# Altium schematic sheet USB_Power.SchDoc
size A4; DocumentNumber: 4; SheetNumber: 4; SheetTotal: 28
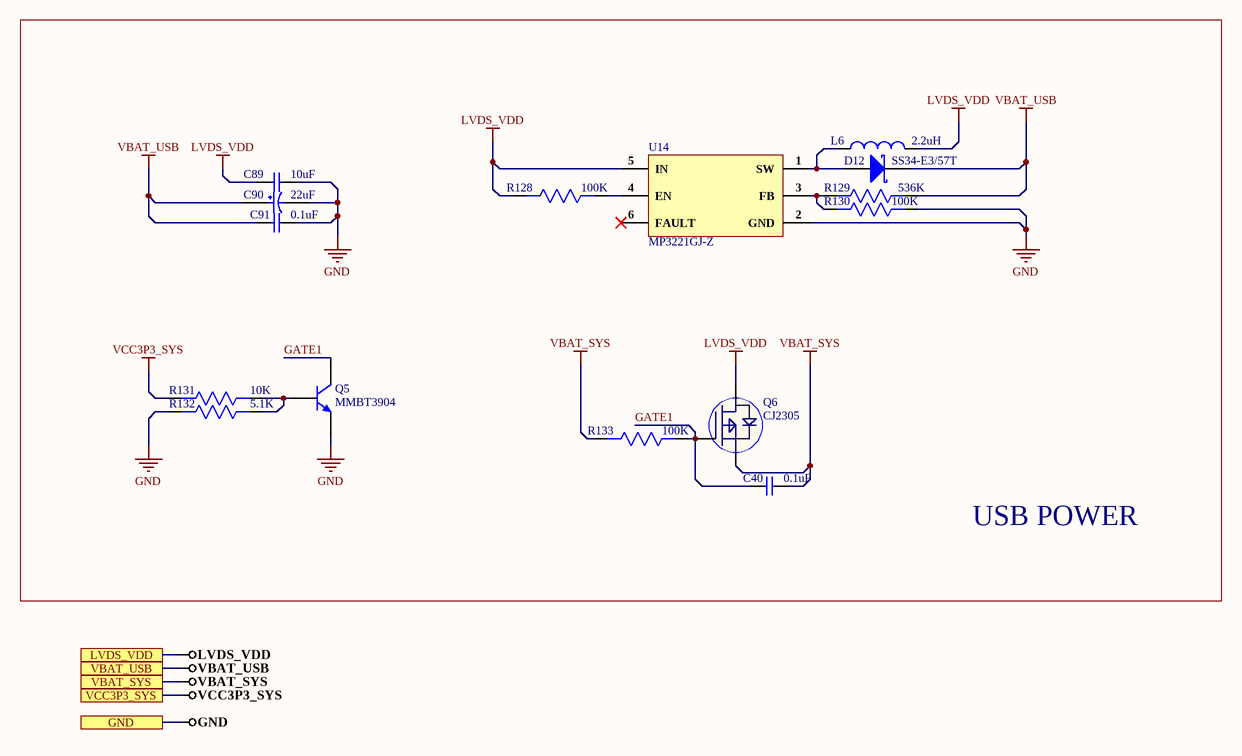
[diagram p0: USB_Power.SchDoc]

## Parts
C40  0.1uF  [Cap0603]
C89  10uF  [Cap0603]
C90  22uF  [T491C226K025AT]
C91  0.1uF  [Cap0603]
D12  SS34-E3/57T  [SMC]
L6  2.2uH  [74437324022]
Q5  MMBT3904  [SOT-23]
Q6  CJ2305  [SOT-23]
R128  100K  [Res0603]
R129  536K  [Res0603]
R130  100K  [Res0603]
R131  10K  [Res0603]
R132  5.1K  [Res0603]
R133  100K  [Res0603]
U14  MP3221GJ-Z  [TSOT-23-6]

## Blocks framed on the sheet
USB POWER: C40 C89-C91 D12 L6 Q5 Q6 R128-R133 U14

## Ports
GND, LVDS_VDD, VBAT_SYS, VBAT_USB, VCC3P3_SYS

## Nets
GND: C89.2 C90.2 C91.2 Q5.2(E) R130.1 R132.2 U14.2(GND) ; port GND
LVDS_VDD: C89.1 L6.2 Q6.3(D) R128.2 U14.5(IN) ; port LVDS_VDD
VBAT_SYS: C40.2 Q6.2(S) R133.2 ; port VBAT_SYS
VBAT_USB: C90.1 C91.1 D12.1(K) R129.1 ; port VBAT_USB
VCC3P3_SYS: R131.2 ; port VCC3P3_SYS
GATE1: C40.1 Q5.3(C) Q6.1(G) R133.1
NetD12_2: D12.2(A) L6.1 U14.1(SW)
NetQ5_1: Q5.1(B) R131.1 R132.1
NetR128_1: R128.1 U14.4(EN)
NetR129_2: R129.2 R130.2 U14.3(FB)

Not connected (* = marked no-connect by the designer): U14 6(FAULT)*

## Library data of the parts
C40 C91 = CC0603ZRY5V9BB104: CAP CER 0.1UF 50V Y5V 0603; Manufacturer: Yageo; Capacitance: 100nF; Tolerance: 80%; Supplier 1: Digi-Key; Manufacturer Part Number: CC0603ZRY5V9BB104; Stock 1: 15000880; Pricing 1: 1=0.1, 10=0.075, 100=0.0334, 500=0.02386, 1000=0.01874 (USD); Mount: Surface Mount; Case/Package: 0603; Number of Pins: 2; Case Code (Metric): 1608; Case Code (Imperial): 0603; Min Operating Temperature: -30°C; Max Operating Temperature: 85°C; Dielectric: Y5V; Voltage Rating: 50V; Package Quantity: 1; Packaging: Tape and Reel; Voltage Rating (DC): 50V; Termination: SMD/SMT; Composition: Ceramic; Voltage: 50V; Length: 1.6mm; Height: 0.8mm; Width: 0.031inch; Thickness: 0.035inch; Depth: 0.8mm; Radiation Hardening: No; REACH SVHC: No SVHC; Lead Free: Lead Free; Halogen Free: Halogen Free; ComponentLink1URL: http://www.yageo.com/documents/recent/UPY-GPHC_Y5V_6.3V-to-50V_8.pdf?src-supplier=Digi-Key; ComponentLink1Description: http://www.yageo.com/documents/recent/UPY-GPHC_Y5V_6.3V-to-50V_8.pdf?src-supplier=Digi-Key; ComponentLink2URL: http://www.yageo.com/documents/recent/UPY-GPHC_Y5V_6.3V-to-50V_5.pdf?src-supplier=Avnet+Europe; ComponentLink2Description: http://www.yageo.com/documents/recent/UPY-GPHC_Y5V_6.3V-to-50V_5.pdf?src-supplier=Avnet+Europe; ComponentLink3URL: https://www.verical.com/server-webapp/html/getDatasheet?partID=403611&src-supplier=Verical; ComponentLink3Description: https://www.verical.com/server-webapp/html/getDatasheet?partID=403611&src-supplier=Verical; ComponentLink4URL: http://www.mouser.com/ds/2/447/Yageo_UPY-GP_NP0_16V-to-50V_9-358835.pdf?src-supplier=Mouser; ComponentLink4Description: http://www.mouser.com/ds/2/447/Yageo_UPY-GP_NP0_16V-to-50V_9-358835.pdf?src-supplier=Mouser; ComponentLink5URL: http://www.farnell.com/datasheets/1132289.pdf?src-supplier=Element14; ComponentLink5Description: http://www.farnell.com/datasheets/1132289.pdf?src-supplier=Element14; Supplier Part Number 1: 311-1343-1-ND
C89 = GRM188R6YA106MA73D: CAP CER 10UF 35V X5R 0603; Manufacturer: Murata; Tolerance: 20%; Supplier 1: Digi-Key; Manufacturer Part Number: GRM188R6YA106MA73D; Stock 1: 11640; Pricing 1: 1=0.5, 10=0.346, 100=0.2076, 500=0.1557, 1000=0.13148 (USD); Mount: Surface Mount; Case/Package: 0603; Case Code (Metric): 1608; Case Code (Imperial): 0603; Min Operating Temperature: -55°C; Max Operating Temperature: 85°C; Packaging: Tape and Reel; Capacitance: 10uF; Voltage Rating: 35V; Voltage Rating (DC): 35V; Dielectric: X5R; Length: 0.063inch; Width: 0.031inch; Thickness: 0.039inch; ComponentLink1URL: http://search.murata.co.jp/Ceramy/image/img/A01X/G101/ENG/GRM188R6YA106MA73-01.pdf?src-supplier=Digi-Key; ComponentLink1Description: http://search.murata.co.jp/Ceramy/image/img/A01X/G101/ENG/GRM188R6YA106MA73-01.pdf?src-supplier=Digi-Key; ComponentLink2URL: http://search.murata.co.jp/Ceramy/image/img/A01X/G101/ENG/GRM188R6YA106MA73-01.pdf?src-supplier=Mouser; ComponentLink2Description: http://search.murata.co.jp/Ceramy/image/img/A01X/G101/ENG/GRM188R6YA106MA73-01.pdf?src-supplier=Mouser; ComponentLink3URL: https://www.murata.com/~/media/webrenewal/support/library/catalog/products/capacitor/mlcc/c02e.ashx?la=en-us&src-supplier=Digi-Key; ComponentLink3Description: https://www.murata.com/~/media/webrenewal/support/library/catalog/products/capacitor/mlcc/c02e.ashx?la=en-us&src-supplier=Digi-Key; ComponentLink4URL: http://search.murata.co.jp/Ceramy/image/img/A01X/G101/ENG/GRM188R6YA106MA73-01.pdf?src-supplier=Future+Electronics; ComponentLink4Description: http://search.murata.co.jp/Ceramy/image/img/A01X/G101/ENG/GRM188R6YA106MA73-01.pdf?src-supplier=Future+Electronics; ComponentLink5URL: http://search.murata.co.jp/Ceramy/image/img/A01X/G101/ENG/GRM188R6YA106MA73-01.pdf?src-supplier=TTI; ComponentLink5Description: http://search.murata.co.jp/Ceramy/image/img/A01X/G101/ENG/GRM188R6YA106MA73-01.pdf?src-supplier=TTI; Supplier Part Number 1: 490-13248-6-ND
C90 = T491C226K025AT: CAP TANT 22UF 10% 25V 2312; Manufacturer: KEMET; Dielectric Material: Tantalum; ESR (Equivalent Series Resistance): 1.4R; Life (Hours): 2000Hour; Ripple Current: 280mA; Leakage Current: 5.5uA; Dissipation Factor: 6%; Polarity: Polar; Supplier 1: Digi-Key; Manufacturer Part Number: T491C226K025AT; Stock 1: 17993; Pricing 1: 1=0.82, 10=0.626, 100=0.4479 (USD); Mount: Surface Mount,PCB; Case/Package: Molded; Number of Pins: 2; Case Code (Metric): 6032; Case Code (Imperial): 2412; Min Operating Temperature: -55°C; Max Operating Temperature: 125°C; Capacitance: 22uF; Tolerance: 10%; Voltage Rating: 25V; Packaging: Tape and Reel; Features: General Purpose; Package Quantity: 1; Voltage Rating (DC): 25V; Termination: SMD/SMT; Voltage: 25V; Length: 6mm; Height: 2.5mm; Width: 0.126inch; Depth: 3.2mm; Height - Seated (Max): 0.11inch; Lead Pitch: 2.9mm; Radiation Hardening: No; Lead Free: Lead Free; REACH SVHC: No SVHC; ComponentLink1URL: https://search.kemet.com/component-edge/download/datasheet/T491C226K025AT.pdf?src-supplier=Digi-Key; ComponentLink1Description: https://search.kemet.com/component-edge/download/datasheet/T491C226K025AT.pdf?src-supplier=Digi-Key; ComponentLink2URL: http://www.jameco.com/Jameco/Products/ProdDS/1573951.pdf?src-supplier=Jameco; ComponentLink2Description: http://www.jameco.com/Jameco/Products/ProdDS/1573951.pdf?src-supplier=Jameco; ComponentLink3URL: https://www.alliedelec.com/m/d/1172a60f7bb3eb66344f86e8fb9ddbde.pdf?src-supplier=Allied+Electronics; ComponentLink3Description: https://www.alliedelec.com/m/d/1172a60f7bb3eb66344f86e8fb9ddbde.pdf?src-supplier=Allied+Electronics; ComponentLink4URL: http://www.farnell.com/datasheets/1698764.pdf?src-supplier=Element14; ComponentLink4Description: http://www.farnell.com/datasheets/1698764.pdf?src-supplier=Element14; ComponentLink5URL: https://api.kemet.com/component-edge/download/datasheet/T491C226K025AT.pdf?src-supplier=Digi-Key; ComponentLink5Description: https://api.kemet.com/component-edge/download/datasheet/T491C226K025AT.pdf?src-supplier=Digi-Key; ComponentLink6URL: http://www.farnell.com/datasheets/1923792.pdf?src-supplier=Element14; ComponentLink6Description: http://www.farnell.com/datasheets/1923792.pdf?src-supplier=Element14; ComponentLink7URL: https://www.distrelec.biz/Web/Downloads/_t/ds/KEM_T2005_T491_eng_tds.pdf?mime=application%2Fpdf&src-supplier=Distrelec; ComponentLink7Description: https://www.distrelec.biz/Web/Downloads/_t/ds/KEM_T2005_T491_eng_tds.pdf?mime=application%2Fpdf&src-supplier=Distrelec; Supplier Part Number 1: 399-3746-1-ND
D12 = SS34-E3/57T: DIODE SCHOTTKY 40V 3A DO214AB; Manufacturer: Vishay Semiconductors; Max Reverse Current: 500uA; Element Configuration: Single; Max Forward Surge Current (Ifsm): 100A; Polarity: Standard; Forward Voltage: 500mV; Supplier 1: Avnet; Manufacturer Part Number: SS34-E3/57T; RoHS: Yes; Category: Rectifier Diodes; Stock 1: 850; Pricing 1: 850=0.23754, 1700=0.19495, 3400=0.19341, 5100=0.19188, 6800=0.19034, 8500=0.18881, 85000=0.18727 (USD); Mount: Surface Mount; Case/Package: SMC; Number of Pins: 2; Contact Plating: Tin,Matte; Min Operating Temperature: -55°C; Max Operating Temperature: 125°C; Packaging: Tape and Reel; Forward Current: 3A; Max Repetitive Reverse Voltage (Vrrm): 40V; Voltage Rating (DC): 40V; Current Rating: 3A; Output Current: 3A; Max Surge Current: 100A; Package Quantity: 1; Average Rectified Current: 3A; Max Reverse Leakage Current: 500uA; Peak Non-Repetitive Surge Current: 100A; Max Reverse Voltage (DC): 40V; Current: 3A; Voltage: 40V; Length: 7.11mm; Width: 6.22mm; Height: 2.417mm; Radiation Hardening: No; Lead Free: Lead Free; REACH SVHC: Unknown; Supplier Part Number 1: SS34-E3/57T
L6 = 74437324022: FIXED IND 2.2UH 3.25A 61 MOHM; Manufacturer: Wurth Electronics; Core Material: Ferrite,Composite; Saturation Current: 6.5A; Tolerance: 20%; Shielding: Shielded; Self Resonant Frequency: 49MHz; DC Resistance (DCR): 61mR; Test Frequency: 100kHz; Supplier 1: Digi-Key; Manufacturer Part Number: 74437324022; RoHS: Yes; Category: Fixed Inductors; Stock 1: 5747; Pricing 1: 1=2.20000, 10=2.15000, 50=1.97100, 100=1.88200, 500=1.79200, 1000=1.70201 (USD); Mount: Surface Mount; Case/Package: Nonstandard; Min Operating Temperature: -40°C; Max Operating Temperature: 125°C; Package Quantity: 3000; Current Rating: 3.25A; Packaging: Tape and Reel; Inductance Tolerance: 20%; Frequency: 49MHz; Resistor Type: Wirewound; Inductance: 2.2uH; Max DC Current: 3.25A; Termination: SMD/SMT; RMS Current (Irms): 3.25A; Series Resistance: 61mR; Series: WE-LHMI; Length: 4.45mm; Width: 4.06mm; Height: 1.8mm; Height - Seated (Max): 0.079inch; Depth: 4.06mm; REACH SVHC: Unknown; RoHS Compliant: Yes; ComponentLink1URL: https://datasheet.ciiva.com/1052/74437324022-1052161.pdf?src-supplier=Digi-Key; ComponentLink1Description: https://datasheet.ciiva.com/1052/74437324022-1052161.pdf?src-supplier=Digi-Key; ComponentLink2URL: https://datasheet.ciiva.com/4961/74437324022-83042-4961251.pdf?src-supplier=Mouser; ComponentLink2Description: https://datasheet.ciiva.com/4961/74437324022-83042-4961251.pdf?src-supplier=Mouser; ComponentLink3URL: https://datasheet.ciiva.com/7892/1735824-7892719.pdf?src-supplier=Element14; ComponentLink3Description: https://datasheet.ciiva.com/7892/1735824-7892719.pdf?src-supplier=Element14; ComponentLink4URL: https://datasheet.ciiva.com/25608/0900766b810c01e6-25608143.pdf?src-supplier=RSComponents; ComponentLink4Description: https://datasheet.ciiva.com/25608/0900766b810c01e6-25608143.pdf?src-supplier=RSComponents; ComponentLink5URL: https://datasheet.ciiva.com/1052/74437324022-1052162.pdf?src-supplier=Digi-Key; ComponentLink5Description: https://datasheet.ciiva.com/1052/74437324022-1052162.pdf?src-supplier=Digi-Key; ComponentLink6URL: https://datasheet.ciiva.com/1052/74437324022-1052163.pdf?src-supplier=Digi-Key; ComponentLink6Description: https://datasheet.ciiva.com/1052/74437324022-1052163.pdf?src-supplier=Digi-Key; ComponentLink7URL: https://datasheet.ciiva.com/48691/001087560-da-01-ml-we-lhmi-smd-speicherdrossel-744373-de-en-48691628.pdf?src-supplier=Conrad; ComponentLink7Description: https://datasheet.ciiva.com/48691/001087560-da-01-ml-we-lhmi-smd-speicherdrossel-744373-de-en-48691628.pdf?src-supplier=Conrad; Supplier Part Number 1: 732-3331-1-ND
Q5 = MMBT3904: TRANS NPN 40V 200MA SOT23-3; Manufacturer: ON Semiconductor / Fairchild; Max Power Dissipation: 350mW; Element Configuration: Single; Transition Frequency: 300MHz; Collector Base Voltage (VCBO): 60V; Emitter Base Voltage (VEBO): 6V; hFE Min: 100; Collector Emitter Saturation Voltage: 300mV; Number of Elements: 1; Supplier 1: Arrow Electronics; Manufacturer Part Number: MMBT3904; RoHS: Yes; Category: BJTs; Stock 1: 1; Pricing 1: 1=0.56240, 10=0.13670, 50=0.12330, 100=0.10020 (USD); Mount: Surface Mount; Case/Package: SOT-23; Number of Pins: 3; Contact Plating: Tin,Matte; Weight: 0.03g; Min Operating Temperature: -55°C; Max Operating Temperature: 150°C; Packaging: Tape and Reel; Polarity: NPN; Collector Emitter Breakdown Voltage: 40V; Package Quantity: 1; Collector Emitter Voltage (VCEO): 40V; Max Collector Current: 200mA; Gain Bandwidth Product: 300MHz; Power Dissipation: 350mW; Voltage Rating (DC): 40V; Max Breakdown Voltage: 40V; Current Rating: 200mA; Frequency: 300MHz; Max Frequency: 300MHz; Termination: SMD/SMT; Length: 0.25inch; Width: 0.25inch; Height: 0.25inch; Radiation Hardening: No; Lead Free: Lead Free; RoHS Compliant: Yes; REACH SVHC: No SVHC; ComponentLink1URL: https://datasheet.ciiva.com/971/mmbt3904-971892.pdf?src-supplier=Digi-Key; ComponentLink1Description: https://datasheet.ciiva.com/971/mmbt3904-971892.pdf?src-supplier=Digi-Key; ComponentLink2URL: https://datasheet.ciiva.com/971/mmbt3904-971893.pdf?src-supplier=Digi-Key; ComponentLink2Description: https://datasheet.ciiva.com/971/mmbt3904-971893.pdf?src-supplier=Digi-Key; ComponentLink3URL: https://datasheet.ciiva.com/22653/1922793-22653482.pdf?src-supplier=Element14; ComponentLink3Description: https://datasheet.ciiva.com/22653/1922793-22653482.pdf?src-supplier=Element14; ComponentLink4URL: https://datasheet.ciiva.com/971/mmbt3904-971891.pdf?src-supplier=Digi-Key; ComponentLink4Description: https://datasheet.ciiva.com/971/mmbt3904-971891.pdf?src-supplier=Digi-Key; ComponentLink5URL: https://datasheet.ciiva.com/26237/mmbt3904-26237242.pdf?src-supplier=Avnet+Europe; ComponentLink5Description: https://datasheet.ciiva.com/26237/mmbt3904-26237242.pdf?src-supplier=Avnet+Europe; ComponentLink6URL: https://datasheet.ciiva.com/7972/2n3904-7972669.pdf?src-supplier=Element14; ComponentLink6Description: https://datasheet.ciiva.com/7972/2n3904-7972669.pdf?src-supplier=Element14; ComponentLink7URL: https://datasheet.ciiva.com/16850/mmbt3904-16850397.pdf?src-supplier=Future+Electronics; ComponentLink7Description: https://datasheet.ciiva.com/16850/mmbt3904-16850397.pdf?src-supplier=Future+Electronics; ComponentLink8URL: https://datasheet.ciiva.com/11201/mmbt3904-11201775.pdf?src-supplier=Avnet; ComponentLink8Description: https://datasheet.ciiva.com/11201/mmbt3904-11201775.pdf?src-supplier=Avnet; Supplier Part Number 1: MMBT3904
Q6 = CJ2305: P-Channel -12V 4.1A 900mV @ 250uA 45mΩ @ 3.5A,4.5V 350mW SOT-23(SOT-23-3) MOSFET RoHS; Manufacturer: Changjiang Electronics Tech (CJ); Value: Custom; Manufacturer Part No: CJ2305; Package: SOT-23
R128 R130 R133 = CRGH0603J100K: RES SMD 100K OHM 5% 1/5W 0603; Manufacturer: TE Connectivity; Resistance: 100kR; Temperature Coefficient: 100ppm/°C; Power Rating: 200mW; Voltage Rating: 50V; Number of Resistors: 1; Supplier 1: Digi-Key; Manufacturer Part Number: CRGH0603J100K; Stock 1: 23277; Pricing 1: 1=0.1, 10=0.049, 100=0.02, 1000=0.00899, 2500=0.0078 (USD); Mount: Surface Mount; Case/Package: 0603; Case Code (Imperial): 0603; Case Code (Metric): 1608; Min Operating Temperature: -55°C; Max Operating Temperature: 125°C; Tolerance: 5%; Packaging: Tape and Reel; Resistor Type: Thick Film,Power resistor; Number of Terminations: 2; Series: CRGH; Termination: Solder; Voltage Rating (DC): 50V; Resistance Tolerance: 5%; Technology: THICK FILM; Length: 1.6mm; Width: 0.8mm; Height: 0.45mm; Depth: 0.8mm; RoHS Compliant: Yes; REACH SVHC: No SVHC; ELV: Compliant; ComponentLink1URL: http://www.farnell.com/datasheets/2007183.pdf?src-supplier=Element14; ComponentLink1Description: http://www.farnell.com/datasheets/2007183.pdf?src-supplier=Element14; Supplier Part Number 1: A126393DKR-ND
R129 = CRCW0603536KFKEA: RES SMD 536K OHM 1% 1/10W 0603; Manufacturer: Vishay; Resistance: 536kR; Max Power Dissipation: 100mW; Temperature Coefficient: 100ppm/°C; Voltage Rating: 75V; Supplier 1: Digi-Key; Manufacturer Part Number: CRCW0603536KFKEA; Stock 1: 4255; Pricing 1: 1=0.1, 10=0.036, 100=0.0145, 1000=0.00652, 2500=0.00566 (USD); Case/Package: 0603; Number of Pins: 2; Weight: 7.1E-05oz; Case Code (Metric): 1608; Case Code (Imperial): 0603; Contact Plating: Tin; Size Code: 0603; Min Operating Temperature: -55°C; Max Operating Temperature: 155°C; Packaging: Tape and Reel; Tolerance: 1%; Package Quantity: 10; Resistor Type: Thick Film; Number of Terminations: 2; Features: Automotive AEC-Q200; Series: CRCW; Power Rating: 100mW; Termination: SMD/SMT; Voltage Rating (DC): 75V; Construction: Rectangular; Technology: THICK FILM; Resistance Tolerance: 1%; Length: 1.55mm; Width: 0.033inch; Height: 0.45mm; Depth: 0.85mm; Radiation Hardening: No; Lead Free: Lead Free; RoHS Compliant: Yes; REACH SVHC: Unknown; Military Standard: Not; ComponentLink1URL: http://www.farnell.com/datasheets/1697337.pdf?src-supplier=Element14; ComponentLink1Description: http://www.farnell.com/datasheets/1697337.pdf?src-supplier=Element14; ComponentLink2URL: http://www.farnell.com/datasheets/2111203.pdf?src-supplier=Element14; ComponentLink2Description: http://www.farnell.com/datasheets/2111203.pdf?src-supplier=Element14; ComponentLink3URL: http://www.vishay.com/docs/20035/dcrcwe3.pdf?src-supplier=Digi-Key; ComponentLink3Description: http://www.vishay.com/docs/20035/dcrcwe3.pdf?src-supplier=Digi-Key; ComponentLink4URL: http://www.mouser.com/ds/2/427/dcrcwe3-109170.pdf?src-supplier=Mouser; ComponentLink4Description: http://www.mouser.com/ds/2/427/dcrcwe3-109170.pdf?src-supplier=Mouser; ComponentLink5URL: http://www.vishay.com/docs/20035/dcrcwe3.pdf?src-supplier=Future+Electronics; ComponentLink5Description: http://www.vishay.com/docs/20035/dcrcwe3.pdf?src-supplier=Future+Electronics; Supplier Part Number 1: 541-536KHDKR-ND
R131 = AC0603JR-0710KL: RES SMD 10K OHM 5% 1/10W 0603; Manufacturer: Yageo; Voltage Rating: 50V; Resistance: 10kR; Power Rating: 100mW; Temperature Coefficient: 100ppm/°C; Supplier 1: Future Electronics; Manufacturer Part Number: AC0603JR-0710KL; RoHS: Yes; Category: Chip SMD Resistors; Stock 1: 1533000; Pricing 1: 5000=0.00540 (USD); Case/Package: 0603; Case Code (Imperial): 0603; Case Code (Metric): 1608; Size Code: 0603; Min Operating Temperature: -55°C; Max Operating Temperature: 155°C; Packaging: Tape and Reel; Tolerance: 5%; Package Quantity: 1; Resistor Type: Thick Film; Termination: SMD/SMT; Number of Terminations: 2; Max Power Dissipation: 100mW; Features: Moisture Resistant,Automotive AEC-Q200,Anti-Sulfur; Series: AC; Construction: Rectangular; Length: 0.063inch; Width: 0.031inch; Height: 0.022inch; Depth: 0.8mm; Military Standard: Not; Lead Free: Lead Free; RoHS Compliant: Yes; ComponentLink1URL: https://datasheet.ciiva.com/5562/pyu-ac-51-rohs-l-2-5562553.pdf?src-supplier=Mouser; ComponentLink1Description: https://datasheet.ciiva.com/5562/pyu-ac-51-rohs-l-2-5562553.pdf?src-supplier=Mouser; Supplier Part Number 1: 1029044
R132 = RC0603JR-075K1L: RES SMD 5.1K OHM 5% 1/10W 0603; Manufacturer: Yageo; Resistance: 5.1kR; Power Rating: 100mW; Voltage Rating: 50V; Temperature Coefficient: 100ppm/°C; Supplier 1: Digi-Key; Manufacturer Part Number: RC0603JR-075K1L; RoHS: Yes; Category: Chip SMD Resistors; Stock 1: 410681; Pricing 1: 1=0.10000, 10=0.02000, 100=0.00800, 1000=0.00360, 2500=0.00312 (USD); Case/Package: 0603; Number of Pins: 2; Case Code (Imperial): 0603; Case Code (Metric): 1608; Size Code: 0603; Min Operating Temperature: -55°C; Max Operating Temperature: 155°C; Tolerance: 5%; Packaging: Tape and Reel; Termination: SMD/SMT; Resistor Type: Thick Film; Voltage Rating (DC): 50V; Features: Moisture Resistant; Series: RC; Max Power Dissipation: 100mW; Number of Terminations: 2; Resistance Tolerance: 5%; Construction: Rectangular; Length: 1.6mm; Depth: 0.8mm; REACH SVHC: No SVHC; Military Standard: Not; Lead Free: Lead Free; RoHS Compliant: Yes; ComponentLink1URL: http://www.mouser.com/ds/2/447/RC0603-272842.pdf?src-supplier=Mouser; ComponentLink1Description: http://www.mouser.com/ds/2/447/RC0603-272842.pdf?src-supplier=Mouser; ComponentLink2URL: http://components.arrow.com/part/dataview/0323_00047491?src-supplier=Arrow+Europe; ComponentLink2Description: http://components.arrow.com/part/dataview/0323_00047491?src-supplier=Arrow+Europe; ComponentLink3URL: http://www.farnell.com/datasheets/2167052.pdf?src-supplier=Farnell; ComponentLink3Description: http://www.farnell.com/datasheets/2167052.pdf?src-supplier=Farnell; ComponentLink4URL: http://www.farnell.com/datasheets/2167052.pdf?src-supplier=Element14; ComponentLink4Description: http://www.farnell.com/datasheets/2167052.pdf?src-supplier=Element14; ComponentLink5URL: http://www.farnell.com/datasheets/2167052.pdf?src-supplier=Newark; ComponentLink5Description: http://www.farnell.com/datasheets/2167052.pdf?src-supplier=Newark; ComponentLink6URL: http://www.farnell.com/datasheets/1868787.pdf?src-supplier=Newark; ComponentLink6Description: http://www.farnell.com/datasheets/1868787.pdf?src-supplier=Newark; ComponentLink7URL: http://www.yageo.com/documents/recent/PYu-RC_Group_51_RoHS_L_10.pdf?src-supplier=Digi-Key; ComponentLink7Description: http://www.yageo.com/documents/recent/PYu-RC_Group_51_RoHS_L_10.pdf?src-supplier=Digi-Key; ComponentLink8URL: http://www.yageo.com/documents/recent/PYu-RC0603_51_RoHS_L_7.pdf?src-supplier=Future+Electronics; ComponentLink8Description: http://www.yageo.com/documents/recent/PYu-RC0603_51_RoHS_L_7.pdf?src-supplier=Future+Electronics; Supplier Part Number 1: 311-5.1KGRCT-ND
U14 = MP3221GJ-Z: IC REG BOOST ADJ 2.7A TSOT23-6; Manufacturer: Monolithic Power Systems; Max Input Voltage: 6V; Min Input Voltage: 2.5V; Number of Outputs: 1; Switching Frequency: 1.2MHz; Operating Supply Current: 270uA; Min Output Voltage: 3V; Synchronous Rectifier: No; Output Type: Adjustable; Output Configuration: Positive; Supplier 1: Digi-Key; Manufacturer Part Number: MP3221GJ-Z; RoHS: Yes; Category: Voltage Regulators - Switching; Stock 1: 2434; Pricing 1: 1=1.97000, 10=1.77000, 25=1.66960, 100=1.33560, 250=1.16864, 500=1.13526, 1000=0.90153 (USD); Mount: Surface Mount; Case/Package: SOT-23-6; Number of Pins: 6; Min Operating Temperature: -40°C; Max Operating Temperature: 125°C; Output Voltage: 6V; Output Current: 2.7A; Packaging: Tape and Reel; Package Quantity: 3000; Min Supply Voltage: 2.5V; Max Output Current: 2.7A; Max Output Voltage: 6V; Topology: Boost; Operating Supply Voltage: 6V; Radiation Hardening: No; Lead Free: Lead Free; RoHS Compliant: Yes; ComponentLink1URL: http://www.mouser.com/ds/2/277/MP3221_r1.0-371792.pdf?src-supplier=Mouser; ComponentLink1Description: http://www.mouser.com/ds/2/277/MP3221_r1.0-371792.pdf?src-supplier=Mouser; ComponentLink2URL: https://www.monolithicpower.com/Lists/Product_NonSynchronous%20Switcher_5745/DispForm.aspx?ID=24&src-supplier=Avnet; ComponentLink2Description: https://www.monolithicpower.com/Lists/Product_NonSynchronous%20Switcher_5745/DispForm.aspx?ID=24&src-supplier=Avnet; ComponentLink3URL: https://www.monolithicpower.com/Lists/Product_NonSynchronous%20Switcher_5745/DispForm.aspx?ID=24&src-supplier=Avnet+Asia; ComponentLink3Description: https://www.monolithicpower.com/Lists/Product_NonSynchronous%20Switcher_5745/DispForm.aspx?ID=24&src-supplier=Avnet+Asia; ComponentLink4URL: http://www.monolithicpower.com/DesktopModules/DocumentManage/API/Document/getDocument?id=891&src-supplier=Digi-Key; ComponentLink4Description: http://www.monolithicpower.com/DesktopModules/DocumentManage/API/Document/getDocument?id=891&src-supplier=Digi-Key; Supplier Part Number 1: 1589-1909-1-ND